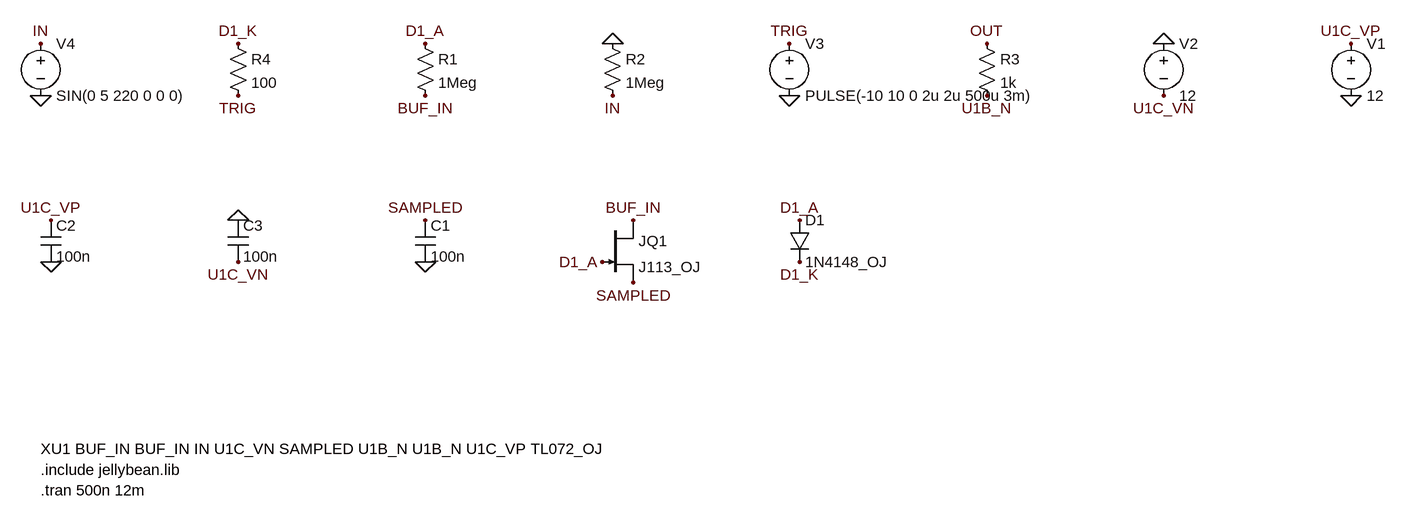
[diagram p0: schematic sample_and_hold.asc]
sample_and_hold.asc, the LTspice schematic file:
Version 4.1
SHEET 1 2400 1600
FLAG 0 16 IN
FLAG 0 96 0
FLAG 304 16 D1_K
FLAG 304 96 TRIG
FLAG 592 16 D1_A
FLAG 592 96 BUF_IN
FLAG 880 16 0
FLAG 880 96 IN
FLAG 1152 16 TRIG
FLAG 1152 96 0
FLAG 1456 16 OUT
FLAG 1456 96 U1B_N
FLAG 1728 16 0
FLAG 1728 96 U1C_VN
FLAG 2016 16 U1C_VP
FLAG 2016 96 0
FLAG 16 288 U1C_VP
FLAG 16 352 0
FLAG 304 288 0
FLAG 304 352 U1C_VN
FLAG 592 288 SAMPLED
FLAG 592 352 0
FLAG 912 288 BUF_IN
FLAG 864 352 D1_A
FLAG 912 384 SAMPLED
FLAG 1168 288 D1_A
FLAG 1168 352 D1_K
SYMBOL voltage 0 0 R0
SYMATTR InstName V4
SYMATTR Value SIN(0 5 220 0 0 0)
SYMATTR Value2 AC 1
SYMBOL res 288 0 R0
SYMATTR InstName R4
SYMATTR Value 100
SYMBOL res 576 0 R0
SYMATTR InstName R1
SYMATTR Value 1Meg
SYMBOL res 864 0 R0
SYMATTR InstName R2
SYMATTR Value 1Meg
SYMBOL voltage 1152 0 R0
SYMATTR InstName V3
SYMATTR Value PULSE(-10 10 0 2u 2u 500u 3m)
SYMBOL res 1440 0 R0
SYMATTR InstName R3
SYMATTR Value 1k
SYMBOL voltage 1728 0 R0
SYMATTR InstName V2
SYMATTR Value 12
SYMBOL voltage 2016 0 R0
SYMATTR InstName V1
SYMATTR Value 12
SYMBOL cap 0 288 R0
SYMATTR InstName C2
SYMATTR Value 100n
SYMBOL cap 288 288 R0
SYMATTR InstName C3
SYMATTR Value 100n
SYMBOL cap 576 288 R0
SYMATTR InstName C1
SYMATTR Value 100n
SYMBOL njf 864 288 R0
SYMATTR InstName JQ1
SYMATTR Value J113_OJ
SYMBOL diode 1152 288 R0
SYMATTR InstName D1
SYMATTR Value 1N4148_OJ
TEXT 0 640 Left 2 !XU1 BUF_IN BUF_IN IN U1C_VN SAMPLED U1B_N U1B_N U1C_VP TL072_OJ
TEXT 0 672 Left 2 !.include jellybean.lib
TEXT 0 704 Left 2 !.tran 500n 12m

The netlist it stands for:
* sample_and_hold.asc
V4 IN 0 SIN(0 5 220 0 0 0) AC 1
R4 D1_K TRIG 100
R1 D1_A BUF_IN 1Meg
R2 0 IN 1Meg
V3 TRIG 0 PULSE(-10 10 0 2u 2u 500u 3m)
R3 OUT U1B_N 1k
V2 0 U1C_VN 12
V1 U1C_VP 0 12
C2 U1C_VP 0 100n
C3 0 U1C_VN 100n
C1 SAMPLED 0 100n
JQ1 BUF_IN D1_A SAMPLED J113_OJ
D1 D1_A D1_K 1N4148_OJ
.model D D
.lib standard.dio
.model NJF NJF
.model PJF PJF
.lib standard.jft
XU1 BUF_IN BUF_IN IN U1C_VN SAMPLED U1B_N U1B_N U1C_VP TL072_OJ
.include jellybean.lib
.tran 500n 12m
.backanno
.end